# Altium project Mosione.PrjPCB
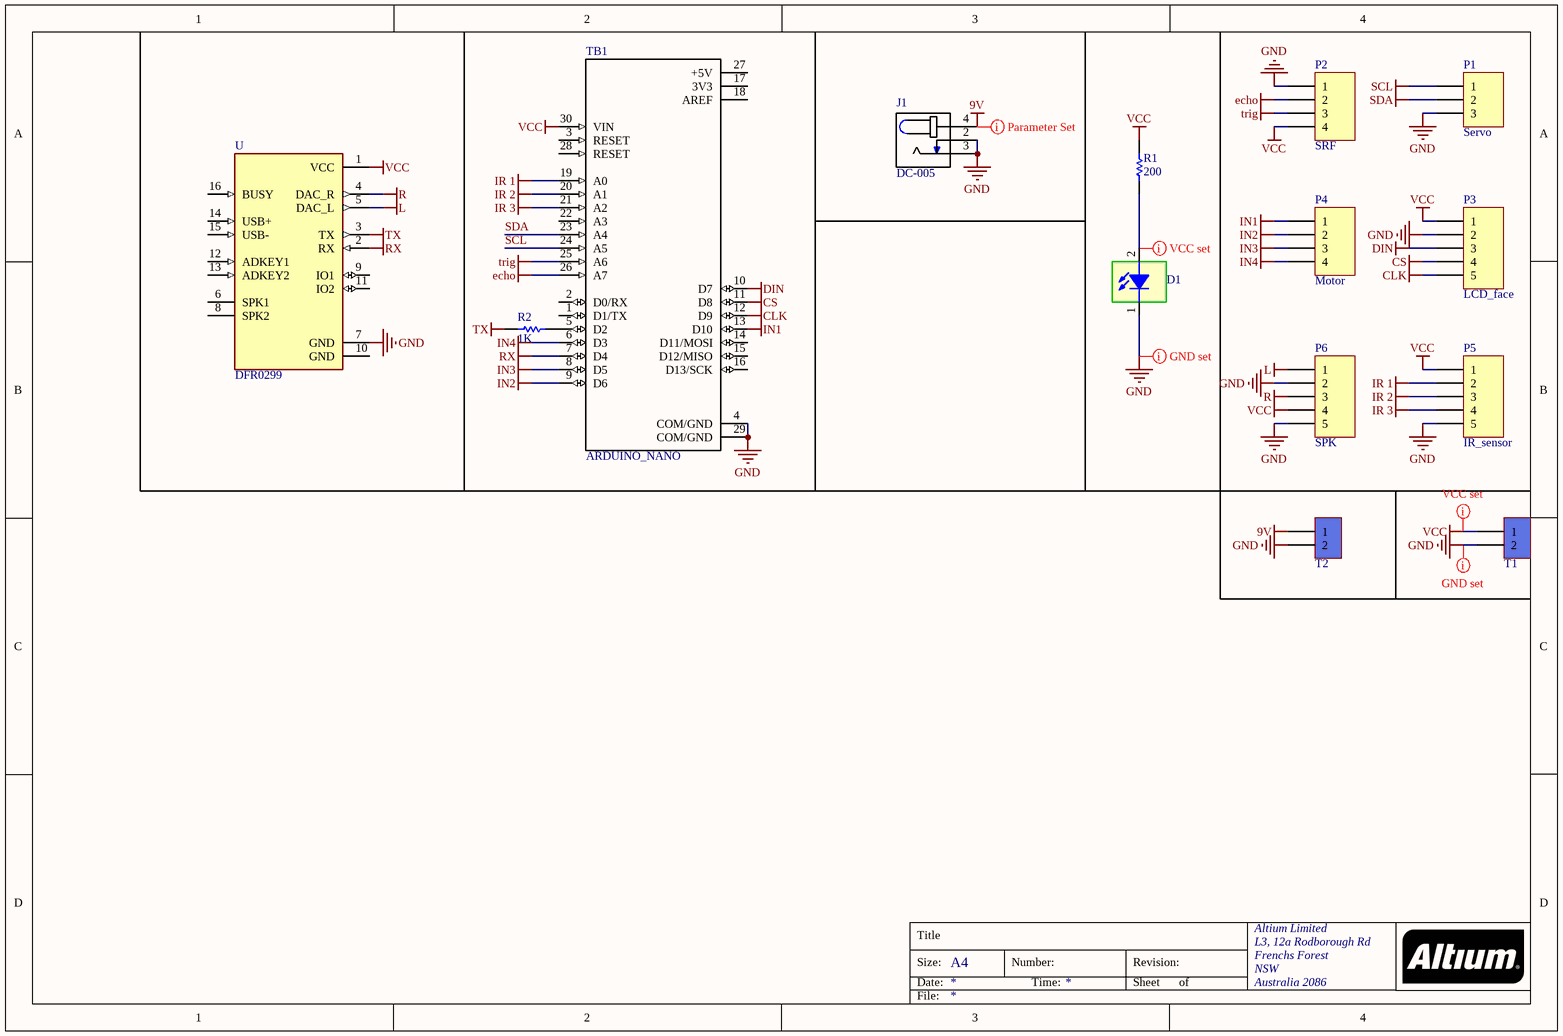
[diagram p0: Mosione.SchDoc]
1 sheet, 14 parts. Net scope: global (net labels, ports and power ports of the same name join across sheets).
Board file: Mosione.PcbDoc

## Sheet Mosione.SchDoc
size A4; Organization: Altium Limited; Address1: L3, 12a Rodborough Rd; Address2: Frenchs Forest; Address3: NSW; Address4: Australia 2086

### Parts
D1  SMD 1206 LED  [LED 1206]  (value not drawn)
J1  DC-005  [*NINIGI_DC-005]
P1  Servo  [HDR1X3]
P2  SRF  [HDR1X4]
P3  LCD_face  [HDR1X5]
P4  Motor  [HDR1X4]
P5  IR_sensor  [HDR1X5]
P6  SPK  [HDR1X5]
R1  200  [RESC3413X04N]
R2  1K  [RESC3413X04N]
T1  KF301_Terminal  [KF301 2PIN]  (value not drawn)
T2  KF301_Terminal  [KF301 2PIN]  (value not drawn)
TB1  ARDUINO_NANO  [*SHIELD_ARDUINO_NANO]
U  DFR0299  [MODULE_DFR0299]

### Nets
9V: J1.4 T2.1
CLK: P3.5 TB1.12(D9)
CS: P3.4 TB1.11(D8)
DIN: P3.3 TB1.10(D7)
echo: P2.2 TB1.26(A7)
GND: D1.1 J1.2 J1.3 P1.3 P2.1 P3.2 P5.5 P6.2 P6.5 T1.2 T2.2 TB1.4(COM/GND) TB1.29(COM/GND) U.7(GND)
IN1: P4.1 TB1.13(D10)
IN2: P4.2 TB1.9(D6)
IN3: P4.3 TB1.8(D5)
IN4: P4.4 TB1.6(D3)
IR 1: P5.2 TB1.19(A0)
IR 2: P5.3 TB1.20(A1)
IR 3: P5.4 TB1.21(A2)
L: P6.1 U.5(DAC_L)
R: P6.3 U.4(DAC_R)
RX: TB1.7(D4) U.2(RX)
SCL: P1.1 TB1.24(A5)
SDA: P1.2 TB1.23(A4)
trig: P2.3 TB1.25(A6)
TX: R2.1 U.3(TX)
VCC: P2.4 P3.1 P5.1 P6.4 R1.2 T1.1 TB1.30(VIN) U.1(VCC)
NetD1_2: D1.2 R1.1
NetR2_2: R2.2 TB1.5(D2)

Not connected (* = marked no-connect by the designer): TB1 1(D1/TX) 2(D0/RX) 3(RESET) 14(D11/MOSI) 15(D12/MISO) 16(D13/SCK) 17(3V3) 18(AREF) 22(A3) 27(+5V) 28(RESET); U 6(SPK1) 8(SPK2) 9(IO1) 10(GND) 11(IO2) 12(ADKEY1) 13(ADKEY2) 14(USB+) 15(USB-) 16(BUSY)

### Layout directives
rule Width Constraint [Pref Width = 1.5mm    Min Width = 1.5mm    Max Width = 2mm]: NetD1_2, VCC
rule Width Constraint [Pref Width = 2mm    Min Width = 0.5mm    Max Width = 2mm]: GND
rule Width Constraint [Pref Width = 1.5mm    Min Width = 0.5mm    Max Width = 2mm]: 9V

### Notes on the sheet
- Title
- Size:
- Date:
- A4
- Number:
- Time:
- Revision:
- Sheet
- of
- File:

### Library data of the parts
D1 = LED SMD 1206
J1 = DC-005: MF: Littelfuse Inc.; Package: 0603 Ninigi; MP: DC-005; SnapEDA_Link: https://www.snapeda.com/parts/DC-005/Littelfuse%20Inc./view-part/?ref=snap; Availability: Unavailable; Price: None; Value: *
P1 = Header 3: Header, 3-Pin; LatestRevisionDate: 17-Jul-2002; LatestRevisionNote: Re-released for DXP Platform.; Publisher: Altium Limited
P2 P4 = Header 4: Header, 4-Pin; LatestRevisionDate: 17-Jul-2002; LatestRevisionNote: Re-released for DXP Platform.; Publisher: Altium Limited
P3 P5 P6 = Header 5: Header, 5-Pin; LatestRevisionDate: 17-Jul-2002; LatestRevisionNote: Re-released for DXP Platform.; Publisher: Altium Limited
R1 R2 = RES 0805 0.125W: RES 0805; Designer: Abbas Basereh; Desc.: RES SMD 0805; Data: 16-12-2016
T1 T2 = KF301-2Pin_Terminal: Terminal 2 Pin 250VAC 16A; Part. No: KF301 2P; Designer: Abbas Basereh; Link: https://www.aliexpress.com/item/
TB1 = ARDUINO_NANO: ATmega4809 Arduino Nano Every with Headers AVRÂ® AVR MCU 8-Bit Embedded Evaluation Board; MP: ARDUINO NANO; Package: None; SnapEDA_Link: https://www.snapeda.com/parts/ARDUINO%20NANO/Arduino/view-part/1128261/?ref=snap; Price: None; MF: Arduino; Availability: Unavailable; Value: *
U = DFR0299: MP3 Player Audio Arduino Platform Evaluation Expansion Board; MF: DFRobot; MP: DFR0299; Availability: Unavailable; Package: None; Value: *; Price: None; SnapEDA_Link: https://www.snapeda.com/parts/DFR0299/DFRobot/view-part/588059/?ref=snap